# Altium schematic sheet integrating_box_light_source.SchDoc
size 297 x 209 mm
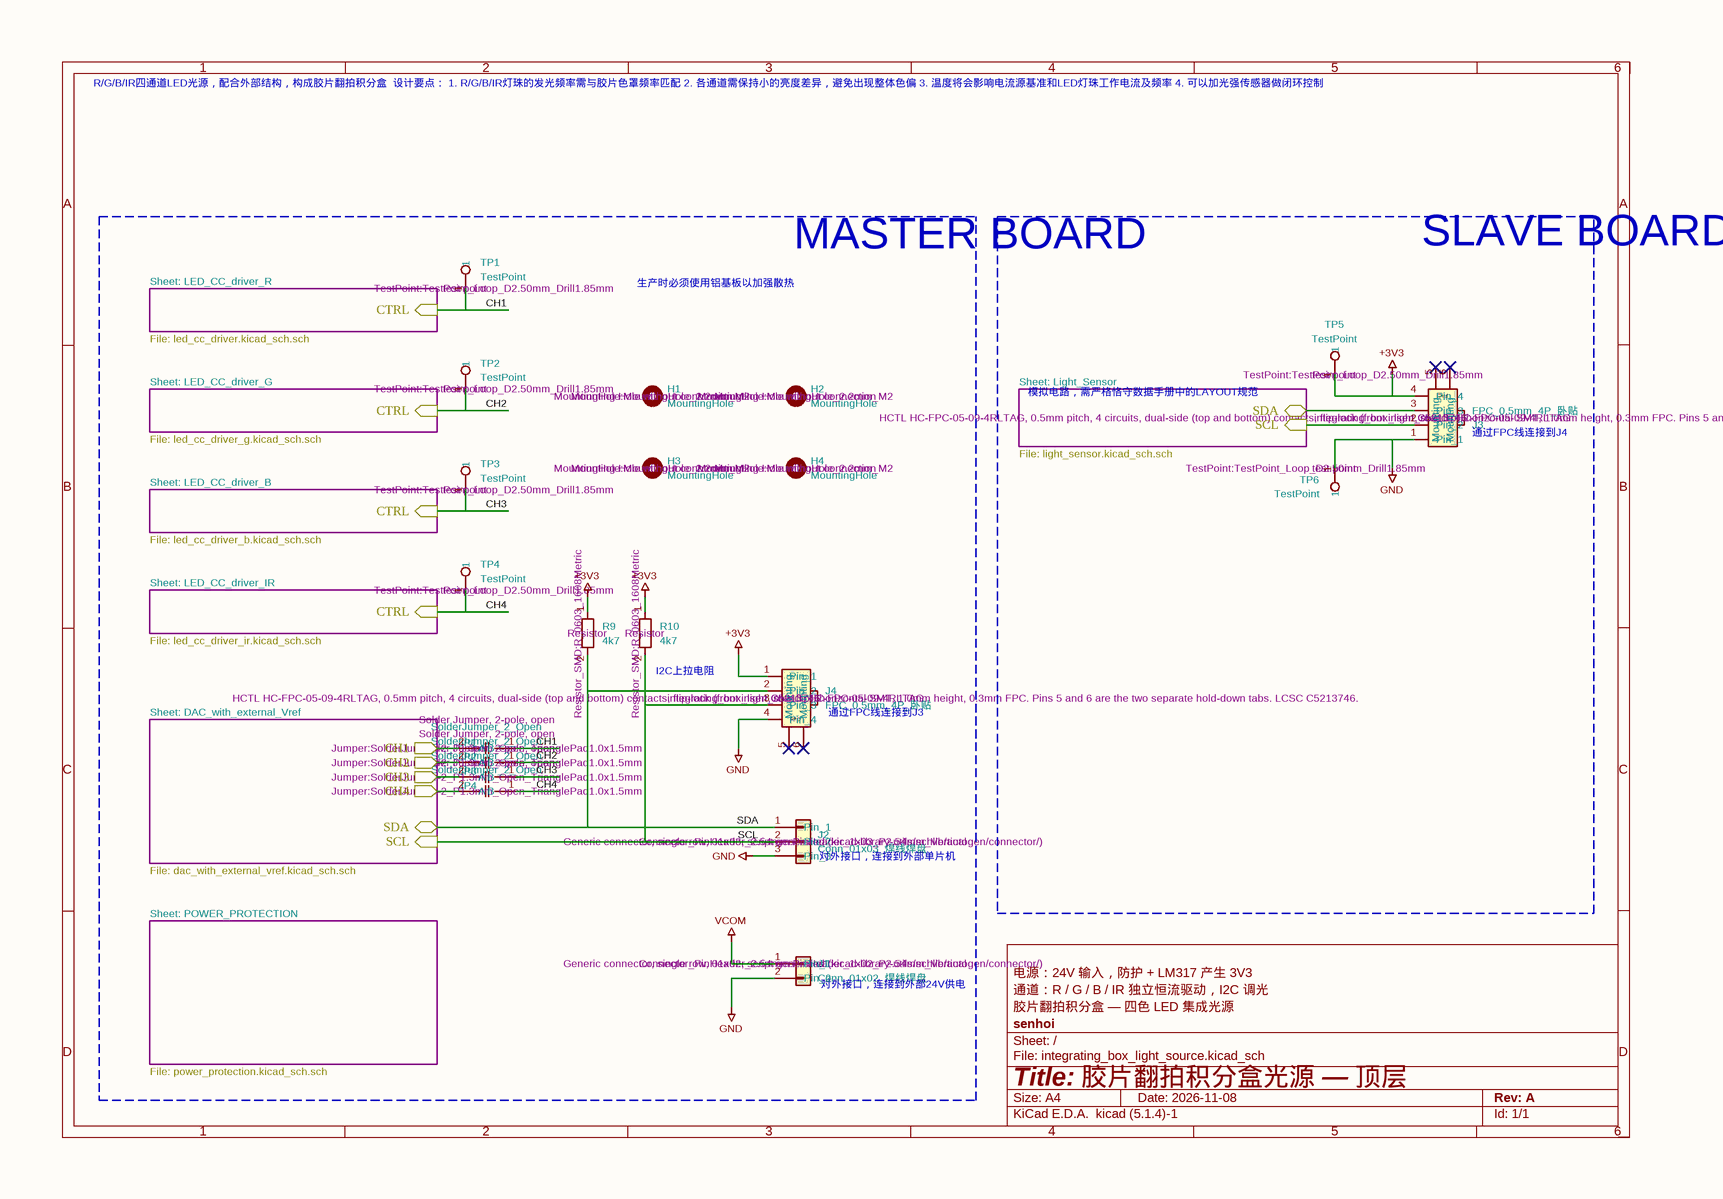
[diagram p0: integrating_box_light_source.SchDoc]

## Parts
H1  Description: Mounting Hole without connection  Footprint: MountingHole:MountingHole_2.2mm_M2  [MountingHole_2.2mm_M2]  (hidden comment: MountingHole)
H2  Description: Mounting Hole without connection  Footprint: MountingHole:MountingHole_2.2mm_M2  [MountingHole_2.2mm_M2]  (hidden comment: MountingHole)
H3  Description: Mounting Hole without connection  Footprint: MountingHole:MountingHole_2.2mm_M2  [MountingHole_2.2mm_M2]  (hidden comment: MountingHole)
H4  Description: Mounting Hole without connection  Footprint: MountingHole:MountingHole_2.2mm_M2  [MountingHole_2.2mm_M2]  (hidden comment: MountingHole)
J1  Description: Generic connector, single row, 01x02, script generated (kicad-library-utils/schlib/autogen/connector/)  Footprint: Connector_PinHeader_2.54mm:PinHeader_1x02_P2.54mm_Vertical  [PinHeader_1x02_P2.54mm_Vertical]  (hidden comment: Conn_01x02_焊线焊盘)
J2  Description: Generic connector, single row, 01x03, script generated (kicad-library-utils/schlib/autogen/connector/)  Footprint: Connector_PinHeader_2.54mm:PinHeader_1x03_P2.54mm_Vertical  [PinHeader_1x03_P2.54mm_Vertical]  (hidden comment: Conn_01x03_焊线焊盘)
J3  Description: HCTL HC-FPC-05-09-4RLTAG, 0.5mm pitch, 4 circuits, dual-side (top and bottom) contacts, flip-lock (front insert, rear flip), horizontal SMT, 1.0mm height, 0.3mm FPC. Pins 5 and 6 are the two separate hold-down tabs. LCSC C5213746.  LCSC: C5213746  Footprint: integrating_box_light_source:HC-FPC-05-09-4RLTAG  [HC-FPC-05-09-4RLTAG]  (hidden comment: FPC_0.5mm_4P_卧贴)
J4  Description: HCTL HC-FPC-05-09-4RLTAG, 0.5mm pitch, 4 circuits, dual-side (top and bottom) contacts, flip-lock (front insert, rear flip), horizontal SMT, 1.0mm height, 0.3mm FPC. Pins 5 and 6 are the two separate hold-down tabs. LCSC C5213746.  LCSC: C5213746  Footprint: integrating_box_light_source:HC-FPC-05-09-4RLTAG  [HC-FPC-05-09-4RLTAG]  (hidden comment: FPC_0.5mm_4P_卧贴)
JP1  Description: Solder Jumper, 2-pole, open  Footprint: Jumper:SolderJumper-2_P1.3mm_Open_TrianglePad1.0x1.5mm  [SolderJumper-2_P1.3mm_Open_TrianglePad1.0x1.5mm]  (hidden comment: SolderJumper_2_Open)
JP2  Description: Solder Jumper, 2-pole, open  Footprint: Jumper:SolderJumper-2_P1.3mm_Open_TrianglePad1.0x1.5mm  [SolderJumper-2_P1.3mm_Open_TrianglePad1.0x1.5mm]  (hidden comment: SolderJumper_2_Open)
JP3  Description: Solder Jumper, 2-pole, open  Footprint: Jumper:SolderJumper-2_P1.3mm_Open_TrianglePad1.0x1.5mm  [SolderJumper-2_P1.3mm_Open_TrianglePad1.0x1.5mm]  (hidden comment: SolderJumper_2_Open)
JP4  Description: Solder Jumper, 2-pole, open  Footprint: Jumper:SolderJumper-2_P1.3mm_Open_TrianglePad1.0x1.5mm  [SolderJumper-2_P1.3mm_Open_TrianglePad1.0x1.5mm]  (hidden comment: SolderJumper_2_Open)
R9  Description: Resistor  Footprint: Resistor_SMD:R_0603_1608Metric  [R_0603_1608Metric]  (hidden comment: 4k7)
R10  Description: Resistor  Footprint: Resistor_SMD:R_0603_1608Metric  [R_0603_1608Metric]  (hidden comment: 4k7)
TP1  Description: test point  Footprint: TestPoint:TestPoint_Loop_D2.50mm_Drill1.85mm  [TestPoint_Loop_D2.50mm_Drill1.85mm]  (hidden comment: TestPoint)
TP2  Description: test point  Footprint: TestPoint:TestPoint_Loop_D2.50mm_Drill1.85mm  [TestPoint_Loop_D2.50mm_Drill1.85mm]  (hidden comment: TestPoint)
TP3  Description: test point  Footprint: TestPoint:TestPoint_Loop_D2.50mm_Drill1.85mm  [TestPoint_Loop_D2.50mm_Drill1.85mm]  (hidden comment: TestPoint)
TP4  Description: test point  Footprint: TestPoint:TestPoint_Loop_D2.50mm_Drill1.85mm  [TestPoint_Loop_D2.50mm_Drill1.85mm]  (hidden comment: TestPoint)
TP5  Description: test point  Footprint: TestPoint:TestPoint_Loop_D2.50mm_Drill1.85mm  [TestPoint_Loop_D2.50mm_Drill1.85mm]  (hidden comment: TestPoint)
TP6  Description: test point  Footprint: TestPoint:TestPoint_Loop_D2.50mm_Drill1.85mm  [TestPoint_Loop_D2.50mm_Drill1.85mm]  (hidden comment: TestPoint)

## Blocks framed on the sheet
MASTER BOARD: H1-H4 J1 J2 J4 JP1-JP4 R9 R10 TP1-TP4
SLAVE BOARD: J3 TP5 TP6

## Sub-sheets
DAC_with_external_Vref = dac_with_external_vref.SchDoc: CH1 (out), CH2 (out), CH3 (out), CH4 (out), SCL (in), SDA (bidir)
LED_CC_driver_B = led_cc_driver_b.SchDoc: CTRL (in)
LED_CC_driver_G = led_cc_driver_g.SchDoc: CTRL (in)
LED_CC_driver_IR = led_cc_driver_ir.SchDoc: CTRL (in)
LED_CC_driver_R = led_cc_driver.SchDoc: CTRL (in)
Light_Sensor = light_sensor.SchDoc: SDA (bidir), SCL (in)
POWER_PROTECTION = power_protection.SchDoc: no entries

## Nets
+3V3: J3.4(Pin_4) J4.1(Pin_1) R9.1 R10.1 TP5.1
GND: J1.2(Pin_2) J2.3(Pin_3) J3.1(Pin_1) J4.4(Pin_4) TP6.1
VCOM: J1.1(Pin_1)
CH1: JP1.1(A) TP1.1 ; sheet LED_CC_driver_R/CTRL
CH2: JP2.1(A) TP2.1 ; sheet LED_CC_driver_G/CTRL
CH3: JP3.1(A) TP3.1 ; sheet LED_CC_driver_B/CTRL
CH4: JP4.1(A) TP4.1 ; sheet LED_CC_driver_IR/CTRL
SCL: J2.2(Pin_2) J4.3(Pin_3) R10.2 ; sheet DAC_with_external_Vref/SCL
SDA: J2.1(Pin_1) J4.2(Pin_2) R9.2 ; sheet DAC_with_external_Vref/SDA
NetJ3_2: J3.2(Pin_2) ; sheet Light_Sensor/SCL
NetJ3_3: J3.3(Pin_3) ; sheet Light_Sensor/SDA
NetJP1_2: JP1.2(B) ; sheet DAC_with_external_Vref/CH1
NetJP2_2: JP2.2(B) ; sheet DAC_with_external_Vref/CH2
NetJP3_2: JP3.2(B) ; sheet DAC_with_external_Vref/CH3
NetJP4_2: JP4.2(B) ; sheet DAC_with_external_Vref/CH4

Not connected (* = marked no-connect by the designer): J3 5(Mounting)* 6(Mounting)*; J4 5(Mounting)* 6(Mounting)*

## Notes on the sheet
- R/G/B/IR四通道LED光源，配合外部结构，构成胶片翻拍积分盒
  设计要点：
  1. R/G/B/IR灯珠的发光频率需与胶片色罩频率匹配
  2. 各通道需保持小的亮度差异，避免出现整体色偏
  3. 温度将会影响电流源基准和LED灯珠工作电流及频率
  4. 可以加光强传感器做闭环控制
- Sheet: LED_CC_driver_R
- 生产时必须使用铝基板以加强散热
- File: led_cc_driver.kicad_sch.sch
- File: led_cc_driver_g.kicad_sch.sch
- Sheet: LED_CC_driver_G
- Sheet: Light_Sensor
- 模拟电路，需严格恪守数据手册中的LAYOUT规范
- Sheet: LED_CC_driver_B
- File: light_sensor.kicad_sch.sch
- (near J3) 通过FPC线连接到J4
- File: led_cc_driver_b.kicad_sch.sch
- File: led_cc_driver_ir.kicad_sch.sch
- Sheet: LED_CC_driver_IR
- Sheet: DAC_with_external_Vref
- (near R10) I2C上拉电阻
- (near J4) 通过FPC线连接到J3
- File: dac_with_external_vref.kicad_sch.sch
- (near J2) 对外接口，连接到外部单片机
- Sheet: POWER_PROTECTION
- (near J1) 对外接口，连接到外部24V供电
- File: power_protection.kicad_sch.sch
- 1
- 2
- 3
- 4
- 5
- 6
- A
- B
- C
- 胶片翻拍积分盒 — 四色 LED 集成光源
- 通道：R / G / B / IR 独立恒流驱动，I2C 调光
- 电源：24V 输入，防护 + LM317 产生 3V3
- D
- Title: 胶片翻拍积分盒光源 — 顶层
- File: integrating_box_light_source.kicad_sch
- Sheet: /
- senhoi
- KiCad E.D.A.  kicad (5.1.4)-1
- Size: A4
- Date: 2026-11-08
- Rev: A
- Id: 1/1
- (in symbol HC-FPC-05-09-4RLTAG) FPC

## Library data of the parts
J1 = Conn_01x02: Value: Conn_01x02_焊线焊盘
J2 = Conn_01x03: Value: Conn_01x03_焊线焊盘
J3 J4 = HC-FPC-05-09-4RLTAG: LCSC Part: C5213746; Value: FPC_0.5mm_4P_卧贴
R9 R10 = R: Value: 4k7
H1-H4 = MountingHole: Value: MountingHole
JP1-JP4 = SolderJumper_2_Open: Value: SolderJumper_2_Open
TP1-TP6 = TestPoint: Value: TestPoint